# EasyEDA Pro project Rear_ESP32S3_R26.epro, board Rear_ESP32S3_V0.3
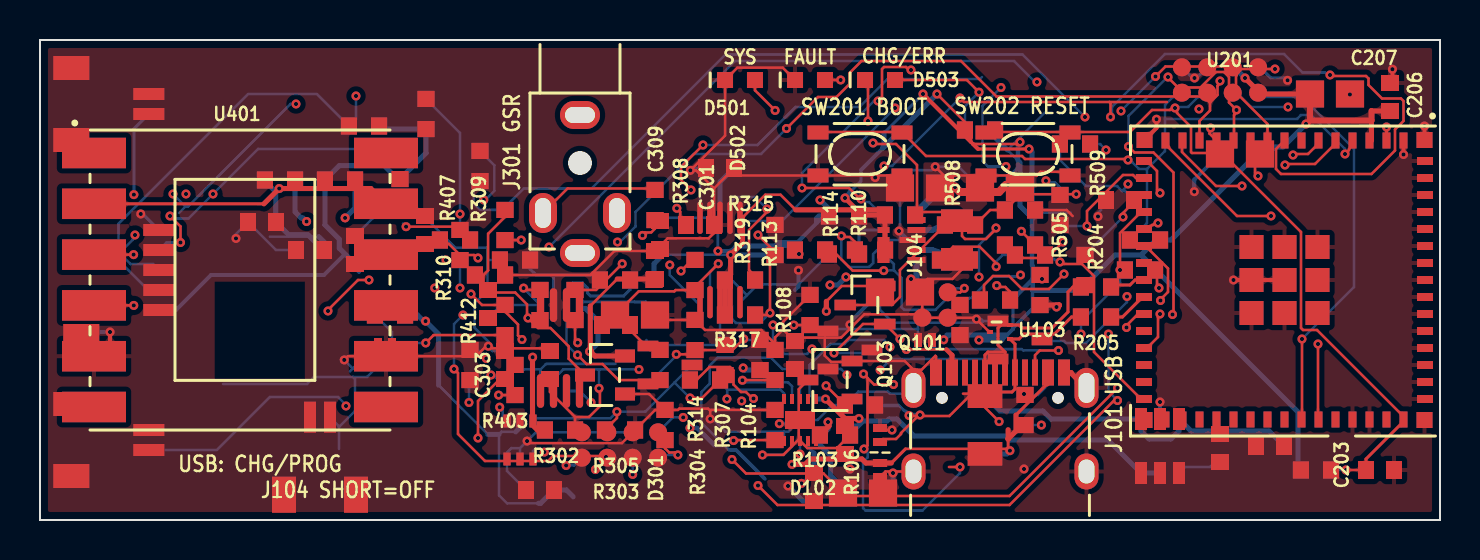
[diagram p6: board, top side]
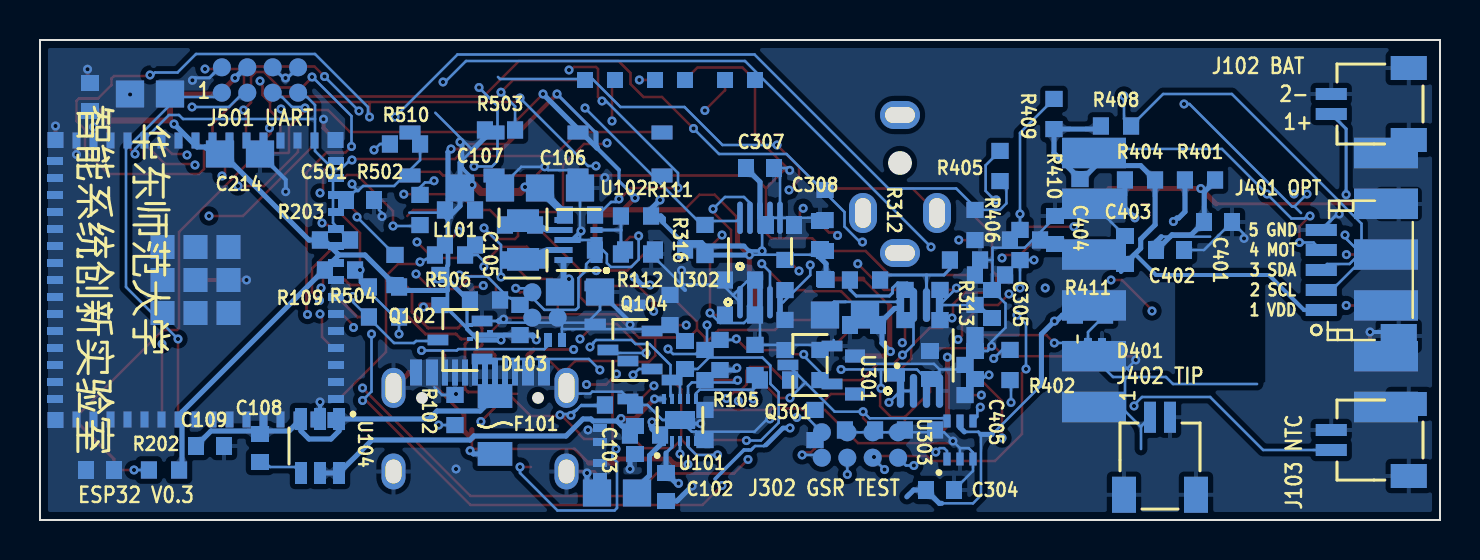
[diagram p7: board, bottom side, seen from below]

Outline 70 x 24 mm; copper layers: Top Layer, Inner1, Inner2, Bottom Layer. Coordinates in mm from the lower left corner of the outline.
Outline path: 0,24 70,24 70,0 0,0 0,24
Stack: Top Layer 0.035mm COPPER / Dielectric1 0.1mm FR4 er 4.5 / Inner1 0.018mm COPPER / Dielectric2 0.694mm FR4 er 4.5 / Inner2 0.018mm COPPER / Dielectric3 0.1mm FR4 er 4.5 / Bottom Layer 0.035mm COPPER

## Design rules (mm)
spacing copperThickness1oz (default): track to track 0.127, other pairs 0.127 to 0.3
spacing copperThickness2oz: track to track 0.203, other pairs 0.152 to 0.3
spacing Plane_innerPlane: track to track 0.127, other pairs 0.127 to 0.3
spacing Copper_copperRegion: track to track 0.127, other pairs 0.127 to 0.3
track width copperThickness1oz (default): min 0.127, default 0.127, max 2.54
track width copperThickness2oz: min 0.203, default 0.254, max 2.54
differential pair differentialPair (default): width min 0.127, default 0.254, max 2.54; gap min 0.152, default 0.152

## Placement (name value [footprint] x y rotation side)
C101  2.2uF  [C0603]  40.25 4 270 bottom
C102  4.7uF  [C0603]  38.7 1.65 270 bottom
C103  10uF  [C0805]  41.15 1.35 0 bottom
C104  51pF  [C0603_NO_PASTE]  37.75 8.25 90 bottom
C105  22uF  [C0805]  43 11.4 180 bottom
C106  22uF  [C0805]  44 16.6 180 bottom
C107  22uF  [C0805]  48 16.6 180 bottom
C108  1nF  [C0603]  59 3.6 90 bottom
C109  2.2uF  [C0603]  61.5 3.7 180 bottom
C203  1uF  [C0603]  67 2.5 0 top
C206  10uF  [C0805]  64.5 21.3 0 top
C207  100nF  [C0603]  67.5 21.15 90 top
C214  10uF  [C0805]  60 18.3 180 bottom
C301  4.7uF  [C0603]  30.75 12.75 90 top
C302  100nF  [C0603]  28.8 9.75 0 bottom
C303  1uF  [C0603]  25.5 7.75 90 top
C304  100nF  [C0603]  25 1.5 180 bottom
C305  100nF  [C0603]  22.4 10.8 90 bottom
C306  10uF  [C0805]  29.75 10.25 0 top
C307  100nF  [C0603]  34 17.6 180 bottom
C308  1uF  [C0603]  31 14.25 90 bottom
C309  100nF  [C0603]  33 14.75 0 top
C401  4.7uF  [C0603]  11.1 14.9 180 bottom
C402  100nF  [C0603]  13.5 13.5 180 bottom
C403  4.7uF  [C0603]  15.75 13.5 90 bottom
C404  100nF  [C0603]  19.25 14.5 90 bottom
C405  1nF  [C0603_NO_PASTE]  23.25 7.75 90 bottom
C501  100nF  [C0603]  54 16 180 bottom
D101  PESD5V0S1UL,315  [SOD-882_L1.0-W0.6-RD]  42 2.5 270 top
D102  PESD5V0S1UL,315  [SOD-882_L1.0-W0.6-RD]  42 4.25 90 top
D103  PESD5V0S1UL,315  [SOD-882_L1.0-W0.6-RD]  44.25 9 180 bottom
D301  BAV199  [SOT-23-3_L2.9-W1.3-P1.90-LS2.4-BR]  28.25 7.25 0 top
D401  PESD5V0S1UL,315  [SOD-882_L1.0-W0.6-RD]  17.25 8.75 180 bottom
D501  LTST-C190KRKT  [LED0603-RD]  35 22 0 top
D502  LTST-C190KRKT  [LED0603-RD]  38.5 22 0 top
D503  LTST-C190KRKT  [LED0603-RD]  42 22 0 top
F101  1206L050/15YR  [F1206]  47.25 4.75 90 bottom
J101  TYPE-C-31-M-12  [USB-C_SMD-TYPE-C-31-M-12_1]  48 4.9 0 top
J102  SM02B-SRSS-TB(LF)(SN)  [CONN-SMD_2P-P1.00_SM02B-SRSS-TB-LF-SN]  3.5 20.8 90 bottom
J103  SM02B-SRSS-TB(LF)(SN)  [CONN-SMD_2P-P1.00_SM02B-SRSS-TB-LF-SN]  3.5 4 90 bottom
J104  TEST PADS  [SMARTPEN_J104_TEST_4P_P1.27]  44.75 10.75 0 top
J301  SJ1-2503A  [AUDIO-TH_SJ1-2503A]  27 16.8 270 top
J302  TEST PADS  [SMARTPEN_J302_TEST_8P_P1.27]  29 3.75 180 bottom
J401  SM05B-SRSS-TB(LF)(SN)  [CONN-SMD_SM05B-SRSS-TB-LF-SN]  4 12.5 90 bottom
J402  SM02B-SRSS-TB(LF)(SN)  [CONN-SMD_2P-P1.00_SM02B-SRSS-TB-LF-SN]  14 3.2 180 bottom
J501  TEST PADS  [SMARTPEN_J501_TEST_8P_P1.27]  59 22 180 bottom
L101  470nH  [IND-SMD_L2.0-W1.6-1]  45.85 14 90 bottom
NOREF  -  [Pad_e2378]  37.75 7.55 90 top
Q101  BSS138  [SOT-23-3_L3.0-W1.7-P0.95-LS2.9-BR]  39.5 7 0 top
Q102  BSS138  [SOT-23-3_L3.0-W1.7-P0.95-LS2.9-BR]  49 9 180 bottom
Q103  BSS84-7-01-F  [SOT-23-3_L2.9-W1.3-P1.90-LS2.3-BR]  41.25 10.75 0 top
Q104  BSS138  [SOT-23-3_L3.0-W1.7-P0.95-LS2.9-BR]  40.5 8.5 180 bottom
Q301  BSS138  [SOT-23-3_L3.0-W1.7-P0.95-LS2.9-BR]  31.5 7.75 180 bottom
R101  5.1kΩ  [R0603]  41 5.75 180 bottom
R102  5.1kΩ  [R0603]  49.25 5.5 90 bottom
R103  24kΩ  [R0603]  36.75 7.75 90 top
R104  5.1kΩ  [R0603]  36.75 4.75 90 top
R105  10kΩ  [R0603_NO_PASTE]  34.25 8 90 bottom
R106  100kΩ  [R0603]  39.75 4.25 0 top
R107  10kΩ  [R0603]  47.75 11 0 top
R108  100kΩ  [R0603]  38.5 10.5 90 top
R109  10kΩ  [R0603]  55 12.5 180 bottom
R110  10kΩ  [R0603]  43 15.25 0 top
R111  59kΩ  [R0603]  40.2 15.2 0 bottom
R112  10kΩ  [R0603]  40.2 13.3 180 bottom
R113  100kΩ  [R0603]  38.5 13.5 0 top
R114  100kΩ  [R0603]  41.5 13.5 0 top
R115  100kΩ  [R0603]  46 10 90 bottom
R202  10kΩ  [R0603]  63.8 2.5 0 bottom
R203  10kΩ  [R0603]  55.25 14 180 bottom
R204  27Ω  [R0603]  52.8 11.65 0 top
R205  27Ω  [R0603]  52.8 10.15 0 top
R301  10Ω  [R0603]  30.7 11.25 270 bottom
R302  56kΩ  [R0603]  26 4.5 0 top
R303  10kΩ  [R0603]  31.25 4.75 90 top
R304  10kΩ  [R0603]  33.25 7 0 top
R305  100kΩ  [R0603]  29 4.5 0 top
R306  100kΩ  [R0603]  36 8.25 90 bottom
R307  1MΩ  [R0603]  32.75 9.25 90 top
R308  100kΩ  [R0603]  30.75 15.75 90 top
R309  100kΩ  [R0603]  23.25 14.75 90 top
R310  100kΩ  [R0603]  22.5 12.25 0 top
R311  22kΩ  [R0603]  25 10.75 90 top
R312  140kΩ  [R0603]  28.75 12 0 bottom
R313  10kΩ  [R0603]  23.75 13 180 bottom
R314  1kΩ  [R0603]  31 7.75 90 top
R315  4.7kΩ  [R0603]  35 12 0 top
R316  4.7kΩ  [R0603]  36.75 14 90 bottom
R317  10kΩ  [R0603]  35 10.25 0 top
R318  1kΩ  [R0603]  26.75 10.75 90 top
R319  0Ω  [R0603_NO_PASTE]  32.75 12.25 90 top
R401  0Ω  [R0603]  12 17 180 bottom
R402  1kΩ  [R0603]  21.5 7.75 90 bottom
R403  1kΩ  [R0603]  23.75 7 90 top
R404  0Ω  [R0603]  15 17 180 bottom
R405  47Ω  [R0603]  22 17.7 90 bottom
R406  47Ω  [R0603]  21 13.75 90 bottom
R407  1kΩ  [R0603]  20.75 14 0 top
R408  4.7kΩ  [R0603_NO_PASTE]  16.2 19.7 180 bottom
R409  4.7kΩ  [R0603_NO_PASTE]  19.3 20.3 90 bottom
R410  10kΩ  [R0603_NO_PASTE]  18 17.8 90 bottom
R411  10kΩ  [R0603]  17.5 10.25 180 bottom
R412  1kΩ  [R0603]  23.25 10 90 top
R501  3.3kΩ  [R0603]  49 13.75 0 top
R502  3.3kΩ  [R0603]  51 15.5 90 bottom
R503  3.3kΩ  [R0603]  47 19.5 180 bottom
R504  10kΩ  [R0603]  52.25 12.5 90 bottom
R505  100kΩ  [R0603]  50 11.5 90 top
R506  10kΩ  [R0603]  49.5 13.25 180 bottom
R507  100kΩ  [R0603]  45.75 13 0 top
R508  330kΩ  [R0603]  46 14.75 0 top
R509  330kΩ  [R0603]  49 15.5 0 top
R510  1kΩ  [R0603]  51.75 18.8 180 bottom
SW201  SKRPACE010  [KEY-SMD_4P-L4.2-W3.2-P2.20-LS4.6]  41 18.3 0 top
SW202  SKRPACE010  [KEY-SMD_4P-L4.2-W3.2-P2.20-LS4.6]  49.4 18.3 0 top
U101  BQ25185DLHR  [WSON-10_L2.2-W2.0-P0.40-BL-EP_TI_DLH0010A]  38 5 180 bottom
U102  TPS63802DLAR  [VSON-10_L3.0-W2.0-P0.50-TL]  43 14 0 bottom
U103  TPD2EUSB30DRTR  [SOT-9X3-3_L1.0-W0.8-P0.35-LS1.0-BR]  48 9.4 0 top
U104  TPS22917DBVR  [SOT-23-6_L2.9-W1.6-P0.95-LS2.8-BR]  56 3.7 90 bottom
U201  ESP32-S3-MINI-1-N4R2  [BULETM-SMD_ESP32-S3-MINI-1-N8]  62.22 12 270 top
U301  OPA2333AIDGKR  [MSOP-8_L3.0-W3.0-P0.65-LS5.0-BL]  26 8.6 180 bottom
U302  ADS1115IDGSR  [MSOP-10_L3.0-W3.0-P0.50-LS5.0-BL]  34 13 180 bottom
U303  TS5A3159DCKR  [SC-70-6_L2.0-W1.3-P0.65-LS2.1-BL-1]  24 4 180 bottom
U401  jy901s  [COMM-SMD_JY901S-1]  10 12 0 top

## Footprints (pads in the part's own frame, mm; a bottom-side part is the same pattern mirrored in y, then rotated)
AUDIO-TH_SJ1-2503A
  oval 1.4x2 hole 0.8x1.5: 1(-3.45,0) 4(3.45,0)
  oval 2x1.4 hole 1.5x0.8: 2(1.45,-1.85) 3(1.45,1.85)
BULETM-SMD_ESP32-S3-MINI-1-N8
  rect 0.8x0.4 hole 0.001: 1(-6.975,5.95) 2(-6.975,5.1) 3(-6.975,4.25) 4(-6.975,3.4) 5(-6.975,2.55) 6(-6.975,1.7) 7(-6.975,0.85) 8(-6.975,0) 9(-6.975,-0.85) 10(-6.975,-1.7) 11(-6.975,-2.55) 12(-6.975,-3.4) 13(-6.975,-4.25) 14(-6.975,-5.1) 15(-6.975,-5.95) 31(6.975,-5.95) 32(6.975,-5.1) 33(6.975,-4.25) 34(6.975,-3.4) 35(6.975,-2.55) 36(6.975,-1.7) 37(6.975,-0.85) 38(6.975,0) 39(6.975,0.85) 40(6.975,1.7) 41(6.975,2.55) 42(6.975,3.4) 43(6.975,4.25) 44(6.975,5.1) 45(6.975,5.95)
  rect 0.4x0.8 hole 0.001: 16(-5.95,-7.025) 17(-5.1,-7.025) 18(-4.25,-7.025) 19(-3.4,-7.025) 20(-2.55,-7.025) 21(-1.7,-7.025) 22(-0.85,-7.025) 23(0,-7.025) 24(0.85,-7.025) 25(1.7,-7.025) 26(2.55,-7.025) 27(3.4,-7.025) 28(4.25,-7.025) 29(5.1,-7.025) 30(5.95,-7.025) 46(5.95,7.025) 47(5.1,7.025) 48(4.25,7.025) 49(3.4,7.025) 50(2.55,7.025) 51(1.7,7.025) 52(0.85,7.025) 53(0,7.025) 54(-0.85,7.025) 55(-1.7,7.025) 56(-2.55,7.025) 57(-3.4,7.025) 58(-4.25,7.025) 59(-5.1,7.025) 60(-5.95,7.025)
  rect 0.8x0.8 hole 0.001: GND(-7,7) GND(-7,-7) GND(7,7) GND(7,-7)
  rect 1.2x1.2 hole 0.001: GND(-1.65,1.65) GND(-1.65,0) GND(-1.65,-1.65) GND(0,1.65) GND(0,0) GND(0,-1.65) GND(1.65,1.65) GND(1.65,0) GND(1.65,-1.65)
C0603
  rect 0.8x0.9 hole 0.001: 1(-0.7,0) 2(0.7,0)
C0603_NO_PASTE
  rect 0.8x0.9 hole 0.001: 1(-0.7,0) 2(0.7,0)
C0805
  rect 1.41x1.35 hole 0.001: 1(-1,0) 2(1,0)
COMM-SMD_JY901S-1
  rect 3.2x1.524 hole 0.001: 1(-7.3,6.35) 2(-7.3,3.81) 3(-7.3,1.27) 4(-7.3,-1.27) 5(-7.3,-3.81) 6(-7.3,-6.35) 7(7.3,-6.35) 8(7.3,-3.81) 9(7.3,-1.27) 10(7.3,1.27) 11(7.3,3.81) 12(7.3,6.35)
CONN-SMD_2P-P1.00_SM02B-SRSS-TB-LF-SN
  rect 0.6x1.55 hole 0.001: 1(-0.5,1.938) 2(0.5,1.938)
  rect 1.2x1.8 hole 0.001: 3(1.8,-1.938) 4(-1.8,-1.938)
CONN-SMD_SM05B-SRSS-TB-LF-SN
  rect 0.6x1.55 hole 0.001: 1(-2,1.938) 2(-0.999,1.938) 3(0.001,1.938) 4(1,1.938) 5(2.001,1.938)
  rect 1.2x1.8 hole 0.001: 6(-3.3,-1.938) 7(3.3,-1.938)
F1206
  rect 1.19x1.728 hole 0.001: 1(-1.445,0) 2(1.445,0)
IND-SMD_L2.0-W1.6-1
  rect 1.133x1.6 hole 0.001: 1(-0.967,0) 2(0.967,0)
KEY-SMD_4P-L4.2-W3.2-P2.20-LS4.6
  rect 1.05x0.7 hole 0.001: 1(-2.1,1.075) 2(2.1,1.075) 3(-2.1,-1.075) 4(2.1,-1.075)
LED0603-RD
  rect 0.8x0.8 hole 0.001: 1(-0.749,0) 2(0.749,0)
MSOP-8_L3.0-W3.0-P0.65-LS5.0-BL
  oval 0.364x1.692 hole 0.001: 1(-0.975,-2.146) 2(-0.325,-2.146) 3(0.325,-2.146) 4(0.975,-2.146) 5(0.975,2.146) 6(0.325,2.146) 7(-0.325,2.146) 8(-0.975,2.146)
MSOP-10_L3.0-W3.0-P0.50-LS5.0-BL
  oval 0.28x1.62 hole 0.001: 1(-1,-2.11) 2(-0.5,-2.11) 3(0,-2.11) 4(0.5,-2.11) 5(1,-2.11) 6(1,2.11) 7(0.5,2.11) 8(0,2.11) 9(-0.5,2.11) 10(-1,2.11)
Pad_e2378
  rect 0.8x0.9 hole 0.001: 1(0,0)
R0603
  rect 0.806x0.864 hole 0.001: 1(-0.753,0) 2(0.753,0)
R0603_NO_PASTE
  rect 0.806x0.864 hole 0.001: 1(-0.753,0) 2(0.753,0)
SC-70-6_L2.0-W1.3-P0.65-LS2.1-BL-1
  rect 0.364x0.65 hole 0.001: 1(-0.65,-0.95) 2(0,-0.95) 3(0.65,-0.95) 4(0.65,0.95) 5(0,0.95) 6(-0.65,0.95)
SMARTPEN_J104_TEST_4P_P1.27
  round 0.9 hole 0.001: 1(0.635,0.635) 2(-0.635,0.635) 3(0.635,-0.635) 4(-0.635,-0.635)
SMARTPEN_J302_TEST_8P_P1.27
  round 0.9 hole 0.001: 1(-1.905,-0.635) 2(-0.635,-0.635) 3(0.635,-0.635) 4(1.905,-0.635) 5(-1.905,0.635) 6(-0.635,0.635) 7(0.635,0.635) 8(1.905,0.635)
SMARTPEN_J501_TEST_8P_P1.27
  round 0.9 hole 0.001: 1(-1.905,-0.635) 2(-0.635,-0.635) 3(0.635,-0.635) 4(1.905,-0.635) 5(-1.905,0.635) 6(-0.635,0.635) 7(0.635,0.635) 8(1.905,0.635)
SOD-882_L1.0-W0.6-RD
  rect 0.4x0.7 hole 0.001: 1(-0.35,0) 2(0.35,0)
SOT-9X3-3_L1.0-W0.8-P0.35-LS1.0-BR
  rect 0.3x0.2 hole 0.001: 1(0.5,-0.35) 2(0.5,0.35) 3(-0.5,0)
SOT-23-3_L2.9-W1.3-P1.90-LS2.3-BR
  rect 1.07x0.532 hole 0.001: 1(0.99,-0.95) 2(0.99,0.95) 3(-0.99,0)
SOT-23-3_L2.9-W1.3-P1.90-LS2.4-BR
  rect 1x0.65 hole 0.001: 1(1,-0.95) 2(1,0.95) 3(-1,0)
SOT-23-3_L3.0-W1.7-P0.95-LS2.9-BR
  rect 1.038x0.532 hole 0.001: 1(1.101,-0.95) 2(1.101,0.95) 3(-1.101,0)
SOT-23-6_L2.9-W1.6-P0.95-LS2.8-BR
  rect 1.1x0.6 hole 0.001: 1(1.35,-0.95) 2(1.35,0) 3(1.35,0.95) 4(-1.35,0.95) 5(-1.35,0) 6(-1.35,-0.95)
USB-C_SMD-TYPE-C-31-M-12_1
  oval 1.2x2 hole 0.8x1.5: 1(4.325,1.706) 4(-4.325,1.706)
  oval 1.2x1.8 hole 0.8x1.2: 2(4.325,-2.474) 3(-4.325,-2.474)
  custom 0.6x1.3 hole 0.001: A1B12(-3.2,2.474) A4B9(-2.4,2.474) B1A12(3.2,2.474) B4A9(2.401,2.474)
  rect 0.3x1.3 hole 0.001: A5(-1.25,2.474) A6(-0.25,2.474) A7(0.25,2.474) A8(1.25,2.474) B5(1.75,2.474) B6(0.75,2.474) B7(-0.75,2.474) B8(-1.75,2.474)
VSON-10_L3.0-W2.0-P0.50-TL
  rect 0.6x0.3 hole 0.001: 1(-0.825,1) 2(-0.825,0.5) 3(-0.825,0) 4(-0.825,-0.5) 5(-0.825,-1)
  rect 0.9x0.3 hole 0.001: 6(0.825,-1) 7(0.825,-0.5) 9(0.825,0.5) 10(0.825,1)
  rect 1.3x0.3 hole 0.001: 8(0.625,0)
WSON-10_L2.2-W2.0-P0.40-BL-EP_TI_DLH0010A
  rect 0.2x0.5 hole 0.001: 1(-0.8,-1.05) 2(-0.4,-1.05) 3(0,-1.05) 4(0.4,-1.05) 5(0.8,-1.05) 6(0.8,1.05) 7(0.4,1.05) 8(0,1.05) 9(-0.4,1.05) 10(-0.8,1.05)
  rect 1.5x0.9 hole 0.001: 11(0,0)

## Nets
As in the schematic, except:
ICHG_SET: C104.1 NOREF.1 R104.1 U101.8

Pads without a net: J101 A8 B8; J301 3 4; U201 7 26 28 29 31 32 33 34 35 36 37 38 41 44; U401 1 6 7 9 10 12

## Via types
v1: diameter 0.452, hole 0.208, Top Layer to Bottom Layer, 177 vias
v2: diameter 0.45, hole 0.21, Top Layer to Bottom Layer, 54 vias

## Routing (per net, layer and track width the routed paths; a pad name or vN(x,y) marks a point on that pad's centre or on a via; arc(x,y) is an arc through that point)
3V45: length 215
  Top Layer w0.127: 46.55,18.9 46.55,19.6 v1(44.85,21.3) ; 37.78,15.51 37.03,16.26 36.26,16.26 35.13,15.12 ; 46.65,18.8 48.9,18.8
  Top Layer w0.152: v1(49.45,18.55) 46.9,18.55
  Top Layer w0.178: 46.65,18.8 46.55,18.9
  Top Layer w0.203: 46.9,18.55 46.65,18.8 ; 46.55,18.9 v1(44.15,21.3)
  Top Layer w0.229: 40.84,15.51 v1(40.25,16.1)
  Top Layer w0.25: C207.1 66.58,20.45 66.58,18.97
  Top Layer w0.254: C206.1 61.05,21.3 v1(60.25,22.1) ; 40.84,15.51 37.78,15.51 ; 40.84,15.51 41.1,15.25 42.25,15.25 42.25,13.5 ; 40.84,15.51 41.99,15.51 ; 35.13,15.12 35.13,13.85 v1(34.53,13.25) 34.53,12.28 34.25,12 34.25,10.25 ; 48.9,18.8 v1(49,18.9) ; 63.5,20 v1(63.3,19.8)
  Top Layer w0.3: C206.1 63.5,19.97 66.58,19.97 66.58,20.45
  Top Layer w0.4: v1(45.75,16.65) 46,16.4 47.95,16.4 48.3,16.75 v1(48.4,16.75)
  Inner2 w0.127: 33.45,12.95 33.5,13 33.5,13.05 ; 17.64,9.94 15.25,12.33 ; 31.35,8.15 31.4,8.1 31.4,8 ; 29.97,9.59 22.51,9.59 ; 34.53,13.26 33.66,13.26
  Inner2 w0.152: 32.05,4.65 32,4.7 31.9,4.7 ; 31.7,7.7 31.7,4.95 ; 21.78,8.85 20.66,8.85 19.57,9.94 ; 33.45,12.95 31.95,11.45 31.95,11.25 ; 31.35,8.45 31.35,8.15 ; 33.55,13.15 33.55,13.1
  Inner2 w0.178: 31.75,4.85 31.75,4.9 31.7,4.95 ; 31.95,11.25 31.35,10.65 31.35,8.45 ; 32.05,4.65 32.45,4.65
  Inner2 w0.203: 31.75,4.85 31.9,4.7
  Inner2 w0.229: 31.4,8 31.7,7.7
  Inner2 w0.254: 17.64,9.94 v1(19.28,9.94) 19.57,9.94 ; v1(39,16) 39.6,16 40.15,16.55 45.65,16.55 v1(45.75,16.65) ; 33.85,13.45 33.66,13.26 33.64,13.26 29.97,9.59 ; 22.51,9.59 21.78,8.85 ; v1(13.33,14.92) 15.08,14.92 v1(15.25,15.11) 15.25,12.33 ; 44.87,8.7 46.65,8.7 v1(46.95,9) ; 44.87,8.7 v1(45.18,9.01) ; 44.87,8.7 44.53,8.36
  Bottom Layer w0.127: 49.92,15.37 51.53,15.37 ; 31.15,13.26 33.89,13.26 ; 33.89,13.26 33.89,15 ; 33.89,13.26 34.52,13.26 ; 24.92,0.83 23.35,0.83 22.95,1.23 22.95,4.28 ; 34.45,13.45 34.5,13.5 34.6,13.5 ; 23.78,4.41 23.08,4.41 ; 34.35,3.6 34.25,3.7 33.8,3.7 ; 50.23,20.36 48.37,18.5 48.9,17.97 ; 37.81,13.87 38.83,14.88 ; 49.63,12.08 49.65,12.1 ; 19.93,6.74 22.39,4.28
  Bottom Layer w0.152: 41.05,17.5 41.05,16.95 40.5,16.4 ; 33.8,3.7 33.75,3.75 33.7,3.75 ; 42.2,19.35 v1(44.15,21.3) ; 48.9,17.65 48.85,17.6 48.85,17.55 ; 23.08,4.41 22.95,4.28 ; 34.35,3.6 34.45,3.5 34.55,3.5 ; 48.65,9.6 48.65,11.05 ; 49.65,12.7 49.63,12.72
  Bottom Layer w0.178: 39.2,15.2 37.7,13.7 36.75,13.7 ; 48.85,17.55 48.4,17.1 ; 49.63,11.48 49.63,10.58 48.65,9.6 48.65,9.55 ; 48.9,17.97 48.9,17.65 ; 34.45,13.45 v1(33.9,13.45) ; 34.55,3.5 34.8,3.5 36.25,2.05 ; 49.6,12.05 49.63,12.08
  Bottom Layer w0.203: 42.15,18.6 41.05,17.5 ; U302.8 33.89,15 ; 34.8,13.7 34.6,13.5 ; 48.1,9 48.65,9.55 ; 49.63,12.08 49.63,12.72 49.6,12.75
  Bottom Layer w0.229: 33.7,3.75 32.85,4.6 v1(32.5,4.6) ; 49.6,12.75 49.6,15.11 ; 49.63,11.48 49.63,12.08 ; 49,17.87 48.9,17.97 48.9,18.8 ; 48.65,11.05 49.6,12
  Bottom Layer w0.254: 26.66,1.16 26.32,1.5 C304.1 25.03,0.83 24.92,0.83 ; v1(19.28,9.94) 19.93,9.29 19.93,6.74 ; v1(44.85,21.3) 42.15,18.6 42.15,18.65 42.2,18.7 42.2,19.35 ; R301.1 30.7,12.81 31.15,13.26 31.15,13.48 ; 55.05,13.25 62.9,5.4 62.9,2.8 ; 55.05,13.25 53.75,13.25 52.25,11.75 ; 55.05,13.25 55.65,13.85 55.7,13.85 55.75,13.9 ; 36.75,13.7 36.75,13.25 34.53,13.25 ; 36.75,13.7 34.8,13.7 ; 36.75,13.7 36.92,13.87 37.81,13.87 ; 39.2,15.2 38.95,15.2 38.83,15.07 38.83,14.88 ; v1(46.95,9) 48.1,9 ; v1(63.3,19.8) 62.15,18.65 61.75,18.65 61.7,18.6 61.65,18.6 61.6,18.55 61.5,18.55 ; 56,14 56.55,14 60.75,18.2 ; v1(15.25,15.11) 15.75,15.6 R404.1 ; v1(39,16) 39.45,15.55 R111.1 ; 48.4,17.1 v1(48.4,16.75) ; 48.3,9.25 R115.1 45.35,9.25 45.35,9.17 v1(45.18,9.01) ; v1(49,18.9) 48.9,18.8 ; R503.1 47.75,19.12 48.37,18.5 ; 12.75,17 12.75,15.41 13.06,15.1 13.15,15.1 v1(13.33,14.92) ; v1(45.75,16.65) 45.2,16.65 43.85,15.3 43.82,15.29 ; 49.63,15.08 49.92,15.37 ; U303.5 24,4.62 23.78,4.41 ; v1(49.45,18.55) 49.6,18.4 49.6,15.11 49,15.71 C107.1 49,17.87 ; U302.8 34,16.9 C307.1 ; 51.98,11.48 49.63,11.48 ; 18.25,10.25 18.87,10.25 19.18,9.94 ; v1(40.25,16.1) 40.5,16.35 40.5,16.4 ; 22.39,4.28 22.95,4.28 ; v1(60.25,22.1) 59.7,22.65
  Bottom Layer w0.3: C106.1 43.82,15.42 U102.6
GND: length 254.9
  Top Layer w0.127: 22.3,8.69 21.8,8.19 15.39,8.19 15.21,8.01 ; 24.46,3.84 29.1,3.84 R305.2 30.76,5.5 R303.2 ; 39.24,9.12 39.24,8.22 39.56,7.9 40.55,7.9 ; 39.24,9.12 37.56,9.12 37.15,9.53 ; 39.24,9.12 40.05,9.12 41.22,10.28 44.11,10.28 44.11,11.78 44.38,12.05 45.62,12.05 46.5,12.94 ; R303.2 31.9,5.5 31.97,5.57 33.4,5.57 33.51,5.46 ; R303.2 30.45,6.3 D301.1 ; 37.15,9.53 37.15,9.91 38.5,11.25 ; 37.15,9.53 36.75,9.12 36.75,8.81 36.07,9.5 33.25,9.5 32.75,10 31,10 ; 33.7,16.58 32.8,17.48 v1(32.52,17.48) 34.25,19.22 D501.1 34.87,22.62 37.13,22.62 37.5,22.25 ; 33.7,16.58 C309.2 33.7,14.35 33.43,14.08 31.38,14.08 30.75,13.45 28.72,13.45 27.52,12.25 R310.2 ; 33.7,16.58 34.34,17.23 43.1,17.23 ; Q101.2 43.23,7.95 43.68,7.51 44.07,7.51 44.77,8.21 44.8,8.18 J101.A1B12 ; v1(44.76,17.66) 45.2,17.23 49.84,17.23 50.03,17.41 51.32,17.41 ; 25.37,8.58 22.53,8.58 ; 51.63,15.2 51.33,15.5 R509.2 ; 44.11,10.11 46.75,10.11 ; 36.75,5.5 33.55,5.5 33.51,5.46 ; v1(46.82,10.04) 47.47,9.4 ; 42,2.15 42.28,2.43 J101.3 ; 33.51,5.46 v1(33.51,5.05) ; 51.56,7.37 51.2,7.37 ; v1(42.6,4.5) 42.1,4.5
  Top Layer w0.15: U201.2 v1(67.32,19.65)
  Top Layer w0.2: 3.5,8.19 v1(3.5,9.4) ; 67.62,21.97 v1(67.62,22.54) ; v1(59.68,12) U201.GND U201.GND ; U201.GND 55.82,19.6 v1(55.82,20.04) ; U201.GND v1(69.22,19.7) ; 68.18,18.97 v1(68.18,18.28)
  Top Layer w0.254: 51.56,7.37 51.56,7.36 51.55,7.35 52.3,6.6
  Inner2 w0.127: 42.41,5.26 42.45,5.3 42.45,5.35 ; 42.41,5.26 42.41,5.34 42.55,5.48 ; 42.41,5.26 42.41,4.69 ; 42.41,5.26 42.4,5.25 ; J101.4 42.55,5.48 ; 42.55,5.48 42.55,5.45 ; 42.55,5.48 42.55,5.5 ; v1(44.76,17.66) 44.22,17.12 v1(41.76,17.12) ; v1(22.42,8.69) 24.35,6.76 v1(24.35,3.95) ; J101.3 42.41,3.7 42.41,4.69 ; 42.41,4.69 42.4,4.7 ; 42.41,4.69 v1(42.6,4.5) ; v1(49.2,6.3) v1(49.2,2.55) ; v1(33.51,5.05) 33.51,10.88 35.27,12.64 35.27,14.73 v1(32.52,17.48) ; 43.07,6 43.05,6
  Bottom Layer w0.127: 28.77,7.81 25.31,7.81 25.02,7.53 ; 15.64,7.57 15.5,7.43 ; 15.64,7.57 v1(15.21,8) ; 15.64,7.57 16.82,8.75 ; 25.02,7.53 U301.4 ; 25.02,7.53 24.18,7.53 23.25,8.45 22.61,8.45 22.58,8.48 22.58,8.53 ; 30.45,8.75 33.98,8.75 ; 38,5 38.88,5 39.63,5.75 R101.2 40.91,6.42 42.39,6.42 42.49,6.32 43.39,6.32 ; C307.2 32.63,17.6 v1(32.52,17.48) ; R102.2 49.9,6.25 50.28,6.63 ; 30.32,8.78 30.32,9 ; 24,3.59 v1(24.35,3.95) 24.79,4.38 J302.7 29.63,4.38 ; 24,3.59 23.57,3.59 23.35,3.38 U303.3 23.35,2.45 C304.2 ; 24,3.59 U303.2 ; C404.2 18.32,16.13 17.23,16.13 16.65,15.56 16.65,15.1 C403.2 ; 43.9,9.55 43.9,9.87 ; 43.9,9.55 D103.2 ; 43.9,9.55 39.49,9.55 ; 43.9,9.87 47.08,9.87 47.16,9.95 ; 43.9,9.87 42.64,9.87 42,10.51 C105.2 ; 37.2,4.42 37.42,4.42 37.82,4.82 ; 37.2,4.42 U101.5 ; 37.2,4.42 34.27,4.42 33.63,5.05 ; 43,14 C106.2 ; 43,14 43.4,14 ; 43,14 42.17,14 ; 47.9,9.95 47.16,9.95 47.07,10.04 v1(46.82,10.04) ; C305.2 21.72,10.83 21.72,9.62 22.42,8.92 v1(22.42,8.69) 22.58,8.53 ; 33,17.3 U302.6 ; U302.6 U302.7 ; U302.6 31.16,15.11 ; 35.35,11.24 35.89,11.78 37.92,11.78 R112.2 ; 35.35,11.24 34.65,11.93 34.35,11.93 34,11.58 ; 35.35,11.24 35,10.89 ; 22.38,11.53 22.38,13 ; 22.38,13 R313.2 ; 22.38,13 22.38,13.59 22.35,13.62 20.76,13.62 19.25,15.13 ; 34,8.77 34,10.89 ; 53.05,15.75 53.05,15.5 52.9,15.35 v1(52.9,15.18) ; 39.4,9.45 38.25,9.45 37.75,8.95 ; 43,17.14 43.36,17.49 44.59,17.49 v1(44.76,17.66) 45.94,17.66 C107.2 ; v1(9.8,14.08) 9.8,14.3 C401.2 11.8,13.5 C402.2
  Bottom Layer w0.15: 57.09,22.64 57.63,22.1 ; J501.7 57.83,22.1 ; 62.28,22.08 62.25,22.08 62.23,22.11 61.53,22.11 61.08,22.56
  Bottom Layer w0.152: 5.94,14.5 5.14,15.3
  Bottom Layer w0.2: 2.06,9.4 v1(3.5,9.4) ; v1(37.92,12.48) 37.92,11.67 37.75,11.5 ; U104.2 v1(56,5.9) ; C105.2 40.5,9.9 v1(40.5,9.77) ; 43.4,14 43,14.4 ; 37.82,4.82 v1(36.97,4.82) ; v1(57.71,16.42) 57.71,17.01 C214.2
  Bottom Layer w0.254: 40.5,3.05 v1(40.5,2.55) ; v1(37.4,1.7) 38.15,0.95 38.7,0.95 ; 42.65,1.6 v1(42.65,2.35)
  vias: v1(42.95,14.45) v1(57.72,22.1) v1(62.38,21.98) v1(65.5,21.28) v2(5.04,15.3)
VBAT: length 99.3
  Top Layer w0.127: 39.32,10.93 40.09,11.7 Q103.2
  Top Layer w0.254: 50.95,10.75 50.95,10.75 50.97,10.75 50.95,10.75 ; 50.95,10.75 R505.1 ; 50.95,10.75 50.95,10.7 50.9,10.65 ; 39.32,10.93 v1(39.32,10.44)
  Inner2 w0.127: v1(35.08,5.95) 34.45,6.59 ; 4.61,3.4 14.69,3.4 ; v1(38.07,1.83) 38.75,1.16 43.87,1.16 46.19,3.48 46.19,5.48 ; 17.68,6.38 21.56,6.38 22.21,5.74 22.21,4.65 25.36,1.49 31.57,1.49 35.08,5 ; 37.1,2.65 37.92,1.83
  Inner2 w0.152: 34.45,6.59 34.45,10.19 ; 1.16,12.74 1.16,6.85 4.61,3.4 ; 14.69,3.4 17.68,6.38
  Inner2 w0.178: 51.21,10.5 51.1,10.39 46.19,5.48
  Inner2 w0.229: 37.1,3.93 37.1,2.65
  Inner2 w0.254: 51.1,10.39 51.1,10.4 51.1,10.45 50.9,10.65 ; v1(39.32,10.44) 37.78,11.97 36.23,11.97 34.45,10.19 ; v1(4.69,16.27) 1.16,12.74 ; 37.1,3.93 v1(35.08,5.95) 35.08,5 ; 37.92,1.83 v1(38.07,1.83)
  Bottom Layer w0.152: 38.7,3.35 38.4,3.65 U101.2 ; J102.1 4.69,19.56 v1(4.69,16.27)
  Bottom Layer w0.254: v1(38.07,1.83) 38.18,1.83 C102.1 38.7,3.35
  vias: v1(50.82,10.65)
VBUS: length 38.7
  Top Layer w0.127: 48.41,4.03 48.41,3.56 43.27,3.56 ; 45.32,8.52 v1(43.32,8.52)
  Top Layer w0.152: 48.8,5.25 50.35,6.8 ; 42.57,2.85 43.27,3.56
  Top Layer w0.229: 45.6,8.24 45.32,8.52
  Top Layer w0.254: 48.41,4.03 48.4,4.05 48.41,4.06 ; 48.41,3.56 v1(48.5,3.47) ; 48.41,4.06 48.8,4.45 48.8,5.25 ; 48.41,4.06 48.41,4.51 ; v1(37.6,2.78) 38.26,2.78 38.53,3.05 41.09,3.05 41.3,2.85 D101.1 42.57,2.85 ; 50.35,6.8 50.35,7.3 ; J101.A4B9 45.6,8.24
  Inner2 w0.127: 37.51,2.87 37.51,5.08 35.97,6.62 ; 43.32,8.03 41.8,6.52 41.8,3.47 41.03,2.7
  Inner2 w0.152: v1(35.16,7.6) 35.97,6.78
  Inner2 w0.229: 35.97,6.78 35.97,6.62
  Inner2 w0.254: 37.51,2.87 v1(37.6,2.78) 37.68,2.7 39.65,2.7 40.3,2.05 40.7,2.05 41.03,2.38 41.03,2.7 ; v1(43.32,8.52) 43.32,8.03
  Bottom Layer w0.254: 47.25,3.3 48.33,3.3 v1(48.5,3.47) ; v1(35.16,7.6) 35.26,7.5 R306.1
AFE_ADC_AUX: length 46.2
  Top Layer w0.127: 63.92,18.82 63.4,18.3 62.7,18.3 ; v1(32.05,12.45) 32.5,12.9
  Inner2 w0.127: 31.9,12.45 31.8,12.35 31.75,12.35 31.7,12.3 28.95,12.3 28.65,12.6 28.65,13.05 29.65,14.05 29.65,14.45 29.85,14.65 29.85,15.5 32.3,17.95 32.75,17.95 36,14.7 40.3,14.7 41.05,13.95 49.3,13.95 51.15,15.8 51.95,15.8 53.65,17.5 54.6,17.5 55.35,18.25 v1(62.65,18.25)
AFE_RDY: length 36
  Top Layer w0.127: v1(35.9,14.25) 36.5,13.65 v1(36.5,10.35) ; 60.65,18.7 60.7,18.65 60.7,18.6 60.75,18.55 60.75,17.35 v1(60.9,17.2) ; 35.75,10.25 36.4,10.25
  Inner2 w0.127: v1(60.9,17.2) 55.85,17.2 55,16.35 52.95,16.35 50.25,13.65 38.7,13.65 38.1,14.25 v1(35.9,14.25)
  Bottom Layer w0.127: 34.55,10.75 34.6,10.7 34.6,10.05 34.8,9.85 36,9.85 v1(36.5,10.35)
AFE_SCL: length 38.2
  Top Layer w0.127: 59.82,22.28 59.43,22.67 56.28,22.67 v2(55.78,22.17) ; 59.82,22.28 59.82,22.3 60.07,22.55 v2(61.75,22.55) ; 59.82,22.28 59.82,22.22 59.8,22.2 59.8,21.38 61.38,19.8 U201.9
  Inner2 w0.127: v1(42.75,20.6) 56.05,20.6 56.5,20.15 57.55,20.15 v1(57.95,20.55)
  Bottom Layer w0.127: v2(54.05,20.45) v2(55.78,22.17) ; 36.9,14.75 v1(42.75,20.6) ; 36.4,14.9 36.35,14.95 35.15,14.95 35,15.1
AFE_SDA: length 56.5
  Top Layer w0.127: 35.6,12.35 35.45,12.5 35.45,14.5 36.35,15.4 ; v2(53.53,20.15) 53.53,20.84 53.47,20.9 ; 64.6,22.2 66.3,22.2 66.43,22.08 66.43,21.75 67.1,21.08 68.05,21.08 68.18,20.95 68.18,19.95 67.75,19.53 67.75,18.47 66.57,17.3 62.05,17.3 61.8,17.55 61.8,18.55 U201.8 ; 53.47,20.9 46.2,20.9 v1(46,21.1) ; 53.47,20.9 56.35,20.9
  Inner2 w0.127: v1(36.35,15.55) 38.4,17.6 42.1,17.6
  Bottom Layer w0.127: 34.5,15.85 34.8,16.15 35.75,16.15 v1(36.35,15.55) ; 64.38,22.25 64.25,22.38 63.12,22.38 62.2,23.3 56.25,23.3 53.6,20.65 53.6,20.22 ; v1(42.2,17.7) 42.6,17.7 v1(46,21.1)
  vias: v2(64.5,22.25)
BAT_ADC: length 16.8
  Top Layer w0.127: 62.3,17.8 63.75,17.8 64.75,18.8
  Inner2 w0.127: v1(54.4,16.8) 55.3,17.7 62.1,17.7
  Bottom Layer w0.127: 54.1,16.45 54.45,16.8 ; 54.1,16.45 53.85,16.7 52.3,16.7 51,18 R510.2 ; 54.1,16.45 54.25,16.45 C501.1
  vias: v1(62.25,17.75)
BAT_DIV: length 9.3
  Top Layer w0.127: R508.2 47.5,15.5 48.25,15.5 49.04,16.29 v1(51.81,16.29)
  Inner2 w0.127: 51.9,16.4 51.9,16.45 52.15,16.7 52.15,17.35 v1(53.3,18.5)
  Bottom Layer w0.127: R510.1 53,18.8 v1(53.3,18.5)
BAT_MEAS: length 7.4
  Top Layer w0.127: 45.25,14.75 42.99,12.5 42.99,11.15 42.59,10.75 Q103.3
BAT_NGATE: length 19.7
  Top Layer w0.127: R507.1 45.66,13.66 46.99,13.66 47.81,12.84 v1(47.81,12.67)
  Inner2 w0.127: v1(40.35,7.25) 40.35,7.51 42.44,9.6 47.17,9.6 49.64,12.06 49.64,12.44 49.37,12.71 47.85,12.71
  Bottom Layer w0.127: v1(47.81,12.67) 47.81,12.93 48.13,13.25 48.75,13.25 ; 39.4,7.55 40.05,7.55 v1(40.35,7.25)
BAT_PGATE: length 49.5
  Top Layer w0.127: v1(33.15,18.75) 32.05,17.65 32.05,17 v1(32.55,16.5) ; v1(43,9.05) 42.25,9.8 41.15,9.8 v1(39.7,8.35)
  Inner1 w0.127: v1(32.55,16.5) 32.55,12.8 35.6,9.75 v1(36.65,9.75)
  Inner2 w0.127: 50.41,11.75 51.65,10.52 51.65,10.35 ; 50.41,11.75 50.4,11.75 v1(50.1,12.05) ; 50.41,11.75 46.66,8 44.35,8 43.8,8.55 43.8,8.7 43.45,9.05 v1(43,9.05) ; v1(39.7,8.35) 39.5,8.55 v1(38.6,8.55)
  Bottom Layer w0.127: v1(33.15,18.75) 35.88,18.75 37.78,20.65 40.97,20.65 42.38,22.05 47,22.05 47.1,22.15 ; 41.45,8.35 v1(39.7,8.35) ; v1(36.65,9.75) 36.65,8.85 37.2,8.3 38.35,8.3 v1(38.6,8.55)
BAT_SENSE_EN: length 9.4
  Top Layer w0.127: 51.15,12.85 51.2,12.8 52.1,12.8 52.7,12.2 52.7,8.4 55.05,6.05
  Bottom Layer w0.127: 50.55,13.1 50.6,13.1 50.65,13.05 50.7,13.05 50.75,13 50.85,13 50.9,12.95
  vias: v1(51,12.9)
BAT_TS: length 40.2
  Inner2 w0.127: v1(34.35,6.05) 34.35,4.66 31.48,1.79 25.46,1.79 22.49,4.77 22.49,5.86 21.67,6.67 16.28,6.67 v2(15.3,5.7)
  Bottom Layer w0.127: U101.6 37.2,6.33 37.01,6.52 34.36,6.52 ; 15.3,5.75 14.9,6.15 11.49,6.15 8.84,3.5 J103.1 ; R105.1 34.25,6.63 34.36,6.52 ; 34.36,6.52 34.36,6.07
BOOT_N: length 35.6
  Top Layer w0.127: 38.9,19.4 43.1,19.4 44.3,18.2 49.1,18.2 49.25,18.05 54.3,18.05 ; 65.5,18.65 65.5,18.6 65.45,18.55 65.45,18.5 v1(65.25,18.3)
  Bottom Layer w0.127: 56.75,21.2 56.7,21.15 56.65,21.15 56.25,20.75 56.25,20.05 ; v1(65.25,18.3) 65.25,18.55 63.55,20.25 63.05,20.25 62.85,20.05 56.25,20.05 ; 55.35,17.55 54.95,17.55 54.6,17.9 54.55,17.9 54.5,17.95 ; 55.35,17.55 55.35,14.85 54.5,14 ; 55.35,17.55 56.25,18.45 56.25,20.05
  vias: v1(54.4,18)
CC1: length 19.5
  Top Layer w0.127: D102.1 42.15,4.05 42.8,4.05 43.05,4.3 43.05,4.35 43.9,5.2 ; 46.56,6.32 v1(47.96,4.92) ; 46.56,6.32 46.15,6.32 ; 46.56,6.32 46.75,6.51 46.75,7.37 ; 43.9,5.2 45.47,5.2 46.54,6.27 ; 43.9,5.2 43.45,5.2
  Inner2 w0.127: v1(47.96,4.92) 47.96,6.14 50.75,8.93 51.74,8.93
  Bottom Layer w0.127: v1(43.45,5.23) 43.18,5.5 ; 43.18,5.5 43.15,5.5 ; 43.18,5.5 43.2,5.5 ; 43.18,5.5 42.93,5.75 41.75,5.75 ; 42.95,5.7 41.8,5.7 ; 43.25,5.45 43.3,5.45 43.45,5.3 43.95,5.3
  vias: v1(44,5.25)
CC2: length 13.5
  Top Layer w0.127: 49.75,7.37 49.75,8.24 49.98,8.48 v1(50.92,8.48)
  Inner2 w0.127: v1(50.07,4.75) 50.07,7.62 v1(50.92,8.48)
  Bottom Layer w0.127: 44.6,8.73 44.78,8.54 49.09,8.54 49.16,8.48 v1(50.92,8.48) ; v1(50.07,4.75) 49.25,4.75
CHG_CE_N: length 10.2
  Top Layer w0.127: 37.94,4.03 37.94,6.54 38.4,7 ; 37.94,4.03 38.37,3.6 39.85,3.6 R106.2 ; 37.94,4.03 37.17,3.26 36.12,3.26
  Bottom Layer w0.127: v1(36.12,3.25) 37.18,3.25 37.6,3.67 U101.4
CHG_EN: length 10.2
  Top Layer w0.127: v1(51.2,12.3) 50.45,11.55 49.1,11.55 48.45,12.2 47.65,12.2 47.2,11.75 47.2,11.4 47.15,11.35 ; 54.9,10.3 54.35,9.75
  Inner2 w0.127: 54.35,9.75 53.75,9.75 v1(51.2,12.3)
  vias: v1(54.32,9.62)
CHG_GATE: length 17.7
  Top Layer w0.127: v1(37.69,9.75) 38.5,9.75 ; 47.91,11.65 48.26,11.65 48.5,11.41 R107.2 ; Q101.1 39.96,6.05 v1(39.3,6.71)
  Inner2 w0.127: 39.3,6.86 42.57,10.13 46.24,10.13 v1(47.84,11.72) ; v1(37.69,9.75) 37.69,8.33 v1(39.3,6.71)
CHG_STAT1: length 40.4
  Top Layer w0.127: 41.38,7.1 41.7,6.78 v2(42.68,6.78) ; 41.38,7.1 v2(41.18,7.3) ; 41.38,7.1 41.38,3.72 v1(41.2,3.55) ; v1(54,12.5) 54,14.35 54.95,15.3 ; 45.45,2.65 v1(46,2.65)
  Inner2 w0.127: 41.18,7.33 v2(42.5,8.65) ; v1(52.05,9.3) 50.65,9.3 47.5,6.15 47.5,4.15 v1(46,2.65)
  Bottom Layer w0.127: 38.43,6.12 38.45,6.15 38.45,6.17 38.47,6.2 38.47,7.75 39.53,8.8 40.22,8.8 40.43,9 42.2,9 42.32,8.88 42.32,8.85 42.35,8.83 42.35,8.8 v2(42.5,8.65) ; v1(54,12.5) 54,11.88 52.05,9.92 v1(52.05,9.3) ; v1(46,2.65) 46,2.35 44.12,0.47 41.28,0.47 41.15,0.6 41.15,2.9 41.38,3.13 41.38,3.37 v1(41.2,3.55)
CHG_STAT2: length 59
  Top Layer w0.127: v2(53.88,5.97) 53.7,5.97 48.47,0.75 36.88,0.75 v2(35.9,1.72) ; 43.85,15.5 43.85,17.75 42.8,18.8 41.7,18.8 ; 43.75,15.4 45.85,15.4 46.1,15.15 46.1,14.2 46.25,14.05 47.3,14.05 47.8,14.55 ; 55.45,14.65 55.5,14.7 55.55,14.7 55.6,14.75 55.65,14.75 55.7,14.8 55.8,14.8 ; v1(41.4,19.95) 41.4,21.7
  Inner1 w0.127: v2(38,3.3) 37.47,3.3 v2(35.9,1.72)
  Inner2 w0.127: 50.55,13.15 50.85,13.45 54.5,13.45 v1(55.9,14.85) ; 50.55,13.15 47.65,13.15 46.95,12.45 v1(46.95,12.15) ; 50.55,13.15 50.55,12.28 53.43,9.4 ; v1(41.4,19.95) 41.65,19.7 v1(41.65,18.85)
  Bottom Layer w0.127: v2(53.88,5.97) 53.43,6.42 v2(53.43,9.3) ; v1(46.95,12.15) 46.95,13.75 v1(47.8,14.6) ; U101.3 v2(38,3.3)
E_SLEEVE: length 8.4
  Top Layer w0.127: 23.25,14 v1(24.06,14)
  Inner2 w0.127: 24.06,14 23.94,14.11 23.94,17.2 27,20.25
E_TIP: length 6
  Top Layer w0.127: 30.68,16.58 26.38,16.58 25.15,15.35
EXC_EN: length 13.2
  Top Layer w0.127: 28.25,4.5 28.85,5.1 v1(28.85,5.42) ; R304.2 33.1,6.1 v1(32.5,6.1)
  Bottom Layer w0.127: 31.73,6.88 32.6,7.75 ; 31.73,6.88 v1(32.5,6.1) ; 31.73,6.88 30.27,5.42 v1(28.85,5.42) 28.52,5.08 24.79,5.08 U303.6
FB_3V45: length 3.1
  Bottom Layer w0.152: 42.17,14.5 40.95,14.5 ; 40.95,14.5 40.95,15.2 ; 40.95,14.5 40.95,13.3
GSR_ADC: length 21.2
  Top Layer w0.127: R314.2 30.5,8.5 28.75,10.25 29.93,11.43 31.72,11.43 31.78,11.5 32.75,11.5 ; v1(33.91,12.81) 32.75,11.65
  Inner2 w0.127: v1(33.91,12.81) 32.26,11.16 32.26,6.48 32.06,6.28 32.06,5.23
  Bottom Layer w0.127: 33.5,10.89 33.5,12.4 v1(33.91,12.81) ; v1(32.16,5.13) 31.65,5.13 J302.5
GSR_EN: length 55.7
  Top Layer w0.127: v2(54.43,18.67) 54.72,18.38 55.67,18.38 56.68,17.37 56.68,10.35 ; 56.38,22.15 56.9,21.62 58.03,21.62 58.8,22.4 59.2,22.4 59.45,22.15 59.45,20.88 v2(59.82,20.5) ; 59.78,20.38 59.75,20.35 59.75,20.33 59.72,20.3 59.72,20.28 59.7,20.25 59.7,19 ; 32.82,7 33.47,7.65 34.5,7.65 34.68,7.47 34.68,6.78 35.05,6.4 35.3,6.4 35.6,6.1 ; v2(53.88,6.6) 48.47,1.2 40.3,1.2 39.18,2.33 35.3,2.33 v2(34.6,3.03)
  Inner1 w0.127: v2(34.6,3.03) 34.6,3.25 35.53,4.17 35.53,5.92 v2(35.68,6.08)
  Inner2 w0.127: v2(53.88,6.6) 53.88,7.55 56.6,10.28
  Bottom Layer w0.127: v2(54.43,18.67) 54.43,20.2 56.38,22.15
  vias: v1(56.4,22.15) v1(56.62,10.28)
GSR_F: length 4.9
  Top Layer w0.127: 24.26,11.59 24.35,11.5 R311.2
  Bottom Layer w0.127: 24.18,11.59 U301.5 23.05,10.75 C305.1
  vias: v1(24.18,11.59)
GSR_N: length 5.3
  Bottom Layer w0.152: 25.67,12.25 24.8,12.25 24.5,12.55 R313.1 ; 25.67,12.25 27.75,12.25 ; 25.67,12.25 25.67,10.75
GSR_OUT: length 20.4
  Top Layer w0.127: v1(26.88,8.25) 27.33,7.8 28.13,7.8 28.93,7 31,7
  Inner2 w0.127: v1(26.31,2.73) 28.4,4.82 28.4,6.76 26.92,8.25
  Bottom Layer w0.127: v1(26.31,2.73) 26.71,2.73 27.09,3.11 ; U301.7 26.32,8.78 26.85,8.25
  Bottom Layer w0.152: 29.5,12 29.5,11.52 29.18,11.2 27.53,11.2 27.38,11.36 27.38,11.59 27.12,11.85 26.64,11.85 26.32,11.53 U301.7
GSR_S: length 31.6
  Top Layer w0.127: 21.75,12.25 22.18,12.25 ; 22.18,12.25 22.41,12.48 22.41,14.31 23.25,15.16 23.25,15.5 ; 22.18,12.25 22.18,11.72 22.53,11.37 23.76,11.37 24.35,10.78 24.35,10 24.5,10 ; 25,10 24.5,10 ; 24.5,10 v1(24.4,10.1) ; 24.5,10 24.9,9.6 25.52,9.6 26.43,8.69 26.43,8.06 27.25,7.25 ; v1(28.3,3.15) 28.25,3.2 25.65,3.2 25.4,2.95 22.25,2.95 20.9,4.3 20.9,7.35 v1(20.7,7.55)
  Inner2 w0.127: v1(21.15,10.25) 24.25,10.25 v1(24.4,10.1)
  Bottom Layer w0.127: J302.3 28.35,3.1 v1(28.3,3.15) ; v1(20.7,7.55) 20.7,9.8 v1(21.15,10.25) ; 28.36,3.11 v1(27.77,2.52)
ICHG_SET: length 13
  Top Layer w0.127: 34.7,4 36.75,4
  Bottom Layer w0.127: 38,7.3 U101.8 ; v1(34.68,3.97) 33.96,3.97 33.07,4.86 33.07,6.4 33.48,6.81 33.48,7.72 33.88,8.12 36.55,8.12 37.12,7.55 37.75,7.55
ILIM_SET: length 4.8
  Top Layer w0.127: 35.13,7 36.75,7
  Bottom Layer w0.127: 35.12,6.88 37.41,6.88 37.6,6.69 U101.7
  vias: v1(35.12,6.99)
IMU_HOST_RX: length 47.3
  Top Layer w0.127: 55.35,12.85 55.85,12.35 55.85,11.7 ; 23.7,7.75 21.9,5.95 v1(21.9,4.1)
  Inner2 w0.127: v1(55.95,11.6) 54.8,10.45 54.8,9.5 53.15,7.85 53.15,5.85 48.15,0.85 25.15,0.85 v1(21.9,4.1)
IMU_HOST_TX: length 48.2
  Top Layer w0.127: 55.28,13.7 56.4,12.58 56.4,11.4 55.97,10.97
  Inner2 w0.127: v2(21.45,5.88) 21.45,3.92 24.8,0.58 48.32,0.58 53.43,5.67 53.43,7.7 55.12,9.4 55.12,10.12 55.97,10.97
  Bottom Layer w0.127: v2(21.45,5.88) 21.45,6.9
  vias: v1(56.03,10.97)
IMU_RX: length 22.8
  Top Layer w0.127: v1(4.68,13.27) 2.7,13.27
  Inner2 w0.127: 22.31,8.08 21.98,8.41 18.26,8.41 13.4,13.27 v1(4.68,13.27)
  Bottom Layer w0.127: v1(22.31,8.07) 21.89,8.5 R402.2
IMU_TX: length 24.1
  Top Layer w0.127: 23.75,6.25 v1(22.93,6.25) ; v1(4.69,10.73) 2.7,10.73
  Inner2 w0.127: v1(4.69,10.73) 6.1,12.14 13.33,12.14 17.35,8.13 21.05,8.13 v1(22.93,6.25)
LED_CHG_A: length 6.6
  Top Layer w0.127: v1(46.95,21.39) 46.34,22 42.75,22
  Bottom Layer w0.127: v1(46.95,21.39) 46.25,20.68 R503.2
LED_FAULT: length 5.7
  Top Layer w0.127: v1(52.35,14.7) 52.35,15.45 54.15,17.25 54.65,17.25 54.8,17.1 U201.17
  Bottom Layer w0.127: v1(52.35,14.7) 51.1,14.7
LED_FAULT_A: length 14.2
  Top Layer w0.127: v1(40.03,22) 39.25,22
  Inner2 w0.127: v1(40.03,22) 41.93,20.1 47.16,20.1 v1(50.3,16.96)
  Bottom Layer w0.127: R502.2 51,16.63 50.75,16.88 50.38,16.88
LED_SYS: length 10.9
  Top Layer w0.127: v1(51.15,13.9) 50.35,13.1 49.15,13.1 48.7,13.55 48.65,13.55 48.6,13.6 48.55,13.6 ; v1(56,16.35) 55.85,16.5 55.85,17.45 55.35,17.95
  Inner2 w0.127: v1(51.15,13.9) 52.25,13.9 53.95,15.6 55.25,15.6 v1(56,16.35)
LED_SYS_A: length 17.7
  Top Layer w0.127: v1(36.76,20.48) 35.75,21.49 35.75,22 ; 49.75,13.75 v1(49.07,14.44)
  Inner2 w0.127: 49.07,14.47 45.15,18.38 39.23,18.38 37.13,20.48 v1(36.76,20.48)
MCU_EN: length 37.7
  Top Layer w0.127: 56.8,20.45 56.85,20.4 56.85,20.35 57.55,19.65 57.55,18.4 57.6,18.35 59.1,18.35 63.05,14.4 63.05,9.6 63.15,9.5 63.85,9.5 68.2,5.15 ; 47.3,19.4 54.5,19.4 55.6,20.5 56.5,20.5 56.55,20.55 56.6,20.55 ; C203.1 v1(65.3,2.5)
  Top Layer w0.15: C203.1 66.3,3.05 68.28,5.03
  Bottom Layer w0.127: 56.8,20.65 57.4,20.65 57.9,21.15 57.95,21.15 58,21.2 58.05,21.2 ; v1(65.3,2.5) 64.55,2.5
  vias: v1(56.75,20.6)
MCU_USB_DM: length 1.9
  Top Layer w0.15: R204.2 53.65,11.75 54.5,11.75 54.75,12 55.3,12
MCU_USB_DP: length 2.2
  Top Layer w0.15: 53.55,10.15 54.12,10.15 55.12,11.15 55.3,11.15
OPT_MOTION: length 56.8
  Top Layer w0.127: v1(60.1,16.7) 58.8,16.7 57.1,18.4 57.1,18.95 ; 21.8,13.2 21.75,13.2 21.7,13.25 21,13.25 20.45,13.8 20.4,13.8 20.35,13.85 20.3,13.85
  Inner2 w0.127: v1(21.9,13.1) 23.9,13.1 24.9,14.1 25.5,14.1 33.85,22.45 42.55,22.45 43.15,21.85 47.15,21.85 47.95,21.05 58.15,21.05 60.45,18.75 62.85,18.75 63.1,18.5 63.1,17.9 61.9,16.7 v1(60.1,16.7)
OPT_MOTION_C: length 31
  Top Layer w0.127: R407.2 20.84,14.67 v1(18.3,14.67) ; v1(6.5,15.2) 7.03,14.67 v1(7.03,13.88)
  Inner2 w0.127: v2(7.3,16.3) 7.42,16.18 8.64,16.18 9.27,15.55 17.42,15.55 v1(18.3,14.67)
  Bottom Layer w0.127: v1(7.03,13.88) 6.33,13.88 5.95,13.5 ; R410.2 10.9,18.55 v2(8.65,16.3) 7.42,15.08 6.78,15.08 6.65,15.2 ; 18.15,14.82 v1(18.3,14.67)
OPT_SCL: length 43.2
  Top Layer w0.127: 58.47,19.6 58.47,19.33 U201.12
  Inner2 w0.127: v2(52.25,20.15) 52.8,19.6 58.47,19.6
  Bottom Layer w0.127: v2(52.25,20.15) 49.12,23.28 34.28,23.28 27.57,16.58 24.19,16.58 23.12,15.51 22,15.51 21.68,15.83 21.68,16.63
  vias: v1(58.53,19.6)
OPT_SCL_C: length 37
  Inner2 w0.127: 21.6,15.42 15.8,21.22 ; 21.6,15.42 v1(22.19,16) ; 21.6,15.42 21.6,13.47 v1(19.74,11.6)
  Bottom Layer w0.127: 5.4,11.5 3.93,12.98 3.93,14.82 10.41,21.3 13.85,21.3 R408.2 15.8,20.05 v2(15.8,21.2) ; 22.27,16 22.72,16.45 22.72,17.73 22,18.45
OPT_SDA: length 49.9
  Top Layer w0.127: 58.5,20.88 58.5,20.47 57.97,19.95 U201.13 ; 58.5,20.88 58.88,21.25 58.88,21.7 58.9,21.72 58.9,21.75 58.93,21.78 58.93,21.8 58.95,21.83 ; 58.5,20.88 58.2,21.17 47.82,21.17 46.05,22.95 41.07,22.95 40.47,22.35 40.47,21.8 39.82,21.15 38.9,21.15 v2(37.32,19.58)
  Inner2 w0.127: v2(28.88,13.9) 28.88,13.67 28.15,12.95 28.15,12.9 26.1,10.85 21.35,10.85 21.1,11.1 21.1,11.5
  Bottom Layer w0.127: 29,13.9 29.78,14.67 29.78,15.4 32.68,18.3 36.05,18.3 v2(37.32,19.58) ; v2(20.3,13) 21,13 v2(21,11.6)
  vias: v2(59,21.95)
OPT_SDA_C: length 39.7
  Top Layer w0.127: v2(16.45,12) 15.9,12 14.4,10.5
  Inner2 w0.127: 16.34,11.88 16.45,11.99 19.03,14.57 ; v2(4.75,14.25) 6.65,16.15 ; 19.03,14.57 12.82,20.78 ; 19.03,14.57 20.27,14.57 v1(21,15.3)
  Bottom Layer w0.127: 7.28,15.68 7.27,15.68 v2(6.65,16.3) ; 7.28,15.68 7.4,15.68 12.52,20.8 v2(12.8,20.8) ; 7.28,15.68 6.95,15.35 ; 4.7,14.12 4.67,14.1 4.67,14.08 4.65,14.05 4.65,14.03 4.22,13.6 4.22,13.1 4.53,12.8 5.65,12.8 5.95,12.5 ; R406.2 v1(21,15.3) 21,19.35 19.3,21.05
  vias: v2(14.4,10.45)
PWR_EN: length 11.5
  Top Layer w0.127: 39.25,13.5 39.6,13.5 40.63,12.47 v1(42.19,12.47) ; v1(46.22,11.58) 46.01,11.38 J104.1
  Bottom Layer w0.127: 42.69,12.48 42.2,12.48 ; 42.69,12.48 42.69,12.79 42.49,13 42.17,13 ; 42.69,12.48 43.08,12.1 43.08,10.64 43.21,10.51 44.78,10.51 45.35,11.08 45.35,11.38 45.55,11.58 v1(46.22,11.58)
PWR_GOOD: length 62.9
  Top Layer w0.127: 55.95,10.2 55.9,10.15 55.9,9.15 55.45,8.7 ; v2(41.9,20.95) 42.1,21.15 42.1,22.55 42.2,22.65 43.3,22.65 43.45,22.5 ; v2(38.1,16.6) 40.45,16.6 41,16.05
  Inner1 w0.127: v2(49.03,12.25) 48.62,12.65 48.62,14.65 48.85,14.88 48.85,16.95 48.3,17.5 v2(48.3,17.67)
  Inner2 w0.127: v2(43.55,22.5) 47.05,22.5 48.15,21.4 56.95,21.4 57,21.35 58.3,21.35 60.6,19.05 63,19.05 63.45,18.6 63.45,17.95 63.35,17.85 63.35,17.65 v2(56,10.3)
  Bottom Layer w0.127: v2(41.9,20.95) 41.7,20.95 38.1,17.35 v2(38.1,16.6) ; v2(41.05,16.05) 41.2,15.9 41.45,15.9 42.15,15.2 42.15,15 ; v2(48.3,17.67) 47.4,17.67 47.12,17.95 47.12,20.7 v2(48.05,21.62) ; 48.9,12.2 48.88,12.17 47.64,12.17 46.56,11.1 46.47,11.1 46.45,11.08 46.43,11.08 46.4,11.05 46.38,11.05 46.35,11.03
PWR_MODE: length 5.2
  Top Layer w0.127: R114.1 40.75,13.9 40.5,14.15 40.12,14.15
  Bottom Layer w0.127: v1(40.07,14.2) 40.07,13.02 40.44,12.65 41.46,12.65 41.66,12.85 41.66,13.29 41.86,13.5 42.17,13.5
SW_L1: length 2.1
  Bottom Layer w0.3: U102.9 44.6,13.5 L101.1
SW_L2: length 2.1
  Bottom Layer w0.3: L101.2 44.6,14.5 U102.7
SYS: length 25.5
  Top Layer w0.254: R106.1 39.45,4.7 v1(39.4,4.9)
  Inner2 w0.254: v1(40.3,12.15) 40.5,11.95 43.45,11.95 v1(43.55,12.05) ; v1(37.95,13.3) v1(39.5,11.75) 39.8,11.45 39.8,10.2 39.55,9.95 39.1,9.95 38.8,10.25 37.45,10.25 37.2,10 37.2,7.1 v1(39.4,4.9) 39.45,4.7
  Bottom Layer w0.254: 39.4,4.65 38.8,4.05 U101.1 ; 39.4,4.65 39.4,4.55 U101.1 ; 39.4,4.65 39.45,4.7 v1(39.4,4.9) 39.4,4.65 ; 40.4,1.35 39.53,2.22 39.53,3.23 U101.1 ; v1(39.5,11.75) 39.9,11.75 v1(40.3,12.15) ; v1(43.55,12.05) 43.82,12.01
  Bottom Layer w0.3: U102.10 43.82,11.7
TIP_RAW: length 21.7
  Top Layer w0.127: 23.25,9.25 19.68,9.25 v1(19.29,8.85)
  Bottom Layer w0.127: 9.15,6.8 13.35,6.8 13.7,7.15 15.65,7.15 ; 14.95,4.65 15.75,5.45 15.75,7.05 15.65,7.15 ; 14.95,4.65 14.95,4.69 14.5,5.14 ; 14.95,4.65 14.95,3.55 ; 15.65,7.15 16.35,7.15 17.6,8.4 17.6,8.75 ; v1(19.29,8.85) 17.6,8.85 17.6,9.4 R411.2
TIP_SW: length 65.8
  Top Layer w0.127: 23.25,10.75 22.1,10.75 v2(21.55,11.3) ; v2(61.55,15.2) 59.85,15.2 56.45,18.6 56.45,18.65 56.4,18.7 ; 23.25,10.42 23.9,9.78 23.9,9.22 v2(24.1,9.03)
  Inner1 w0.127: v2(22.55,7.25) 24.1,8.8 v2(24.1,9.03)
  Inner2 w0.127: v2(25.45,13.65) 23.1,11.3 v2(21.55,11.3) ; 61.55,15.35 63.65,17.45 63.65,17.65 63.75,17.75 63.75,18.72 63.3,19.17 63.3,19.25 63.25,19.3 63.1,19.3 61.2,21.2 59,21.2 58.55,21.65 57.15,21.65 57.1,21.7 50.15,21.7 50.05,21.8 50,21.8 49.95,21.85
  Bottom Layer w0.127: 49.7,21.95 48.7,22.95 34.75,22.95 v2(25.45,13.65) ; 22.68,7.2 22.7,7.17 22.72,7.17 22.75,7.15 22.78,7.15 22.8,7.12 22.85,7.12 22.88,7.1
  vias: v2(49.85,21.9)
UART0_RX: length 19.5
  Top Layer w0.127: 63.9,5.05 v2(63.9,8.8)
  Inner2 w0.127: v2(63.9,8.8) 64.05,8.95 64.05,19.75 63.15,20.65 v2(62.4,20.65)
  Bottom Layer w0.127: 59.95,21.2 60,21.2 60.55,20.65 v2(62.4,20.65)
UART0_TX: length 20.1
  Top Layer w0.127: 63.1,5.05 v2(63.1,9.05)
  Bottom Layer w0.127: 61.25,21.2 61.3,21.15 63.1,21.15 65.7,18.55 65.7,11.65 v2(63.1,9.05)
USB_5V: length 19.7
  Top Layer w0.254: v2(40.95,5.08) 40.25,5.08 v2(39.28,6.05)
  Bottom Layer w0.254: C101.1 40.9,4.7 41.15,4.95 ; 41.15,4.95 42.35,4.95 42.45,5.05 42.85,5.05 43.7,4.2 48.3,4.2 48.5,4 53.4,4 U104.6 U104.5 ; 41.15,4.95 41.07,5.03 41.03,5.03 ; v2(39.28,6.05) U101.10
USB_ABSENT: length 16.4
  Top Layer w0.127: 54.95,16.15 54.15,15.35 v2(54.15,15.15)
  Inner2 w0.127: v2(54.15,15.15) 54.3,15.3 56.15,15.3 56.35,15.1 56.35,13.15 54.35,11.15
  Bottom Layer w0.127: 52.25,13.25 v2(54.15,15.15) ; 54.35,11.15 54.35,10.9 52.3,8.85 51.3,8.85 51.2,8.95 50.2,8.95
  vias: v1(54.35,11.17)
USB_CT: length 1.9
  Bottom Layer w0.127: U104.4 57.25,2.65 58.5,2.65 58.55,2.7 58.6,2.7 58.65,2.75
USB_DET_GATE: length 24.5
  Top Layer w0.127: 32.75,8.5 34.63,8.5 v1(35.18,9.06) ; v1(31.81,8.28) 32.54,8.28
  Inner2 w0.127: v1(35.18,9.06) 35.18,8.35 39.56,3.97 41.03,3.97 41.52,4.47 41.52,7.02 v1(42.01,7.5)
  Bottom Layer w0.127: v1(42.01,7.5) 42.56,8.05 47.9,8.05 ; 35.3,9.06 35.35,9 R306.2 ; Q301.1 31.81,8.21
USB_DM: length 10
  Top Layer w0.15: 48.25,8.4 47.9,8.75 47.9,9.6 48.05,9.75 U103.2 48.95,9.75 49.1,9.6 50.6,9.6 51.4,10.4 51.4,11.4 51.65,11.65 52.05,11.65 ; 48.25,8.4 47.4,8.4 47.25,8.25 47.25,7.37 ; 48.25,8.4 J101.A7
USB_DP: length 8.6
  Top Layer w0.15: J101.A6 47.75,6.55 47.9,6.4 48.6,6.4 48.75,6.55 J101.B6 48.75,8.8 48.5,9.05 48.95,9.05 49.2,9.3 50.72,9.3 51.57,10.15 52.05,10.15
USB_RAW: length 17.5
  Bottom Layer w0.254: C109.1 61.45,4.45 57.55,4.45 U104.3 56.95,4.45 56.55,4.05 55.45,4.05 55.05,4.45 U104.1 50.55,5.05 50.15,5.45 47.99,5.45 47.25,6.19
VAA: length 23
  Top Layer w0.127: 27.52,10.71 28.86,12.05
  Top Layer w0.254: 24.63,8.14 24.63,4.75 24.87,4.5 25.25,4.5 ; 27.52,10.71 27.52,8.42 27.74,8.2 D301.2 ; 28.86,12.05 30.75,12.05
  Inner2 w0.127: 27.48,8.9 27.07,9.3 25.79,9.3 v1(24.63,8.14)
  Inner2 w0.254: 27.48,8.9 v1(27.48,8.42)
  Bottom Layer w0.127: 29.72,10.91 27.08,10.91
  Bottom Layer w0.152: 29.72,10.91 30.29,10.91 30.7,10.5
  Bottom Layer w0.254: 26.97,10.58 27.27,10.58 C302.1 27.9,9.55 27.9,8.84 v1(27.48,8.42) ; 27.08,10.91 26.97,10.8
VEX: length 40.8
  Top Layer w0.127: 30.75,15 30.75,14.57 30.56,14.38 30.27,14.38 v1(30.12,14.23) ; 26.75,10 26.75,9 v1(26.89,8.86)
  Inner2 w0.127: v1(30.12,14.23) 30.12,14.5 31.65,16.03 32.85,16.03 34.98,13.9 34.98,12.89 32.94,10.85 32.94,3.66 31.56,2.28 v1(29.63,2.28) ; 24.55,3.5 24.55,3.43 25.9,2.08 29.43,2.08 29.63,2.28 ; 24.55,3.5 24.18,3.5 22.98,4.69 v1(22.98,5.64) ; 24.55,3.5 25.58,4.53 25.58,7.58 26.86,8.86
  Bottom Layer w0.127: U303.4 23.13,5.17 23.13,5.49 v1(22.98,5.64) ; 29.63,3.11 v1(29.63,2.28)
VEX_BUF: length 5.9
  Inner2 w0.127: 25.21,3.54 v1(27.55,5.88)
  Bottom Layer w0.127: U303.1 24.65,3.45 24.8,3.59 25.01,3.59 v1(25.21,3.4) ; U301.1 v1(27.55,5.88)
  Bottom Layer w0.152: 26.97,6.45 26.32,6.45
VEX_MON: length 11.6
  Top Layer w0.127: 32.01,15.04 32.01,15.42 v1(31.84,15.59) ; 26.75,11.5 27.8,11.5 v1(29.11,12.81)
  Inner2 w0.127: 30.87,13.37 30.31,12.81 v1(29.11,12.81) ; 30.87,13.37 v1(31.49,12.75) ; 30.87,13.37 31.84,14.34 v1(31.84,15.59)
  Bottom Layer w0.127: 33,10.89 32.84,10.89 31.49,12.24 v1(31.49,12.75)
VIMU: length 23.9
  Top Layer w0.152: 11.2,15.81 2.7,15.81
  Top Layer w0.254: 17.3,15.81 16.54,16.57 v1(11.96,16.57) 11.2,15.81
  Bottom Layer w0.127: 13.93,14.17 11.5,14.17
  Bottom Layer w0.254: C402.1 14.2,13.9 13.93,14.17 ; C401.1 12.44,14.26 13.4,14.26 14.16,13.5 ; 11.79,16.4 v1(11.96,16.57) ; 11.79,16.4 11.25,16.94 ; 11.79,16.4 11.79,14.9
VOPT: length 30.1
  Bottom Layer w0.2: C403.1 16.5,13.55 16.3,13.55 15.65,12.9 ; 15.3,13.25 15.2,13.25 14.2,12.25 8.55,12.25 6.8,10.5 J401.1 ; 15.95,12.4 15.75,12.6
  Bottom Layer w0.254: 18,17.05 19.3,18.35 19.3,19.55 17.11,19.55 ; C403.1 15.65,12.9 15.3,13.25 14.97,13.58 14.97,14.04 14.25,14.76 R404.2 14.97,17.72 17.21,17.72 17.88,17.05 ; C404.1 16.75,13.8 16.5,13.55
VREF: length 17.9
  Top Layer w0.127: 26.75,5.15 25.5,6.4 25.5,7.05 ; 26.75,5.15 27.45,5.15 28,5.69 28,6.54 ; 26.75,5.15 R302.2 ; 31.25,4 31.25,3.58 31.46,3.38 31.77,3.38 v1(31.9,3.25)
  Inner2 w0.127: v1(31.9,3.25) 29.95,5.2 v1(29.95,7.53)
  Bottom Layer w0.127: 25.67,7.05 26.15,7.53 27.95,7.53 ; 27.95,7.53 v1(27.95,6.58) ; 27.95,7.53 v1(29.95,7.53) ; 31.04,3.25 v1(31.9,3.25)

## Copper pours and planes (outline as drawn; the poured copper is in the pictures)
GND on Top Layer: 0.4,0.4 0.4,23.6 69.6,23.6 69.6,0.4
GND on Bottom Layer: 0.4,0.4 0.4,23.6 69.6,23.6 69.6,0.4
GND on Inner1: 0.4,0.4 0.4,23.6 69.6,23.6 69.6,0.4

Small or netless copper shapes (teardrops, artwork), in the pictures only: 379 on Top Layer, 443 on Bottom Layer, 9 on Inner1, 175 on Inner2

## Text on the board
Bottom Silkscreen Layer: 5 GND | 4 MOT | 3 SDA | 2 SCL | 1 VDD | J401 OPT | 1 | 1+ | 2- | J102 BAT | J402 TIP | J302 GSR TEST | J501 UART | ESP32 V0.3 | J103 NTC | 华东师范大学 | 智能系统创新实验室
Top Silkscreen Layer: SYS | FAULT | CHG/ERR | USB: CHG/PROG | J104 SHORT=OFF | SW201 BOOT | SW202 RESET | J301 GSR | J101 USB
